# Altium schematic sheet TOR TETRA.SchDoc
size A3
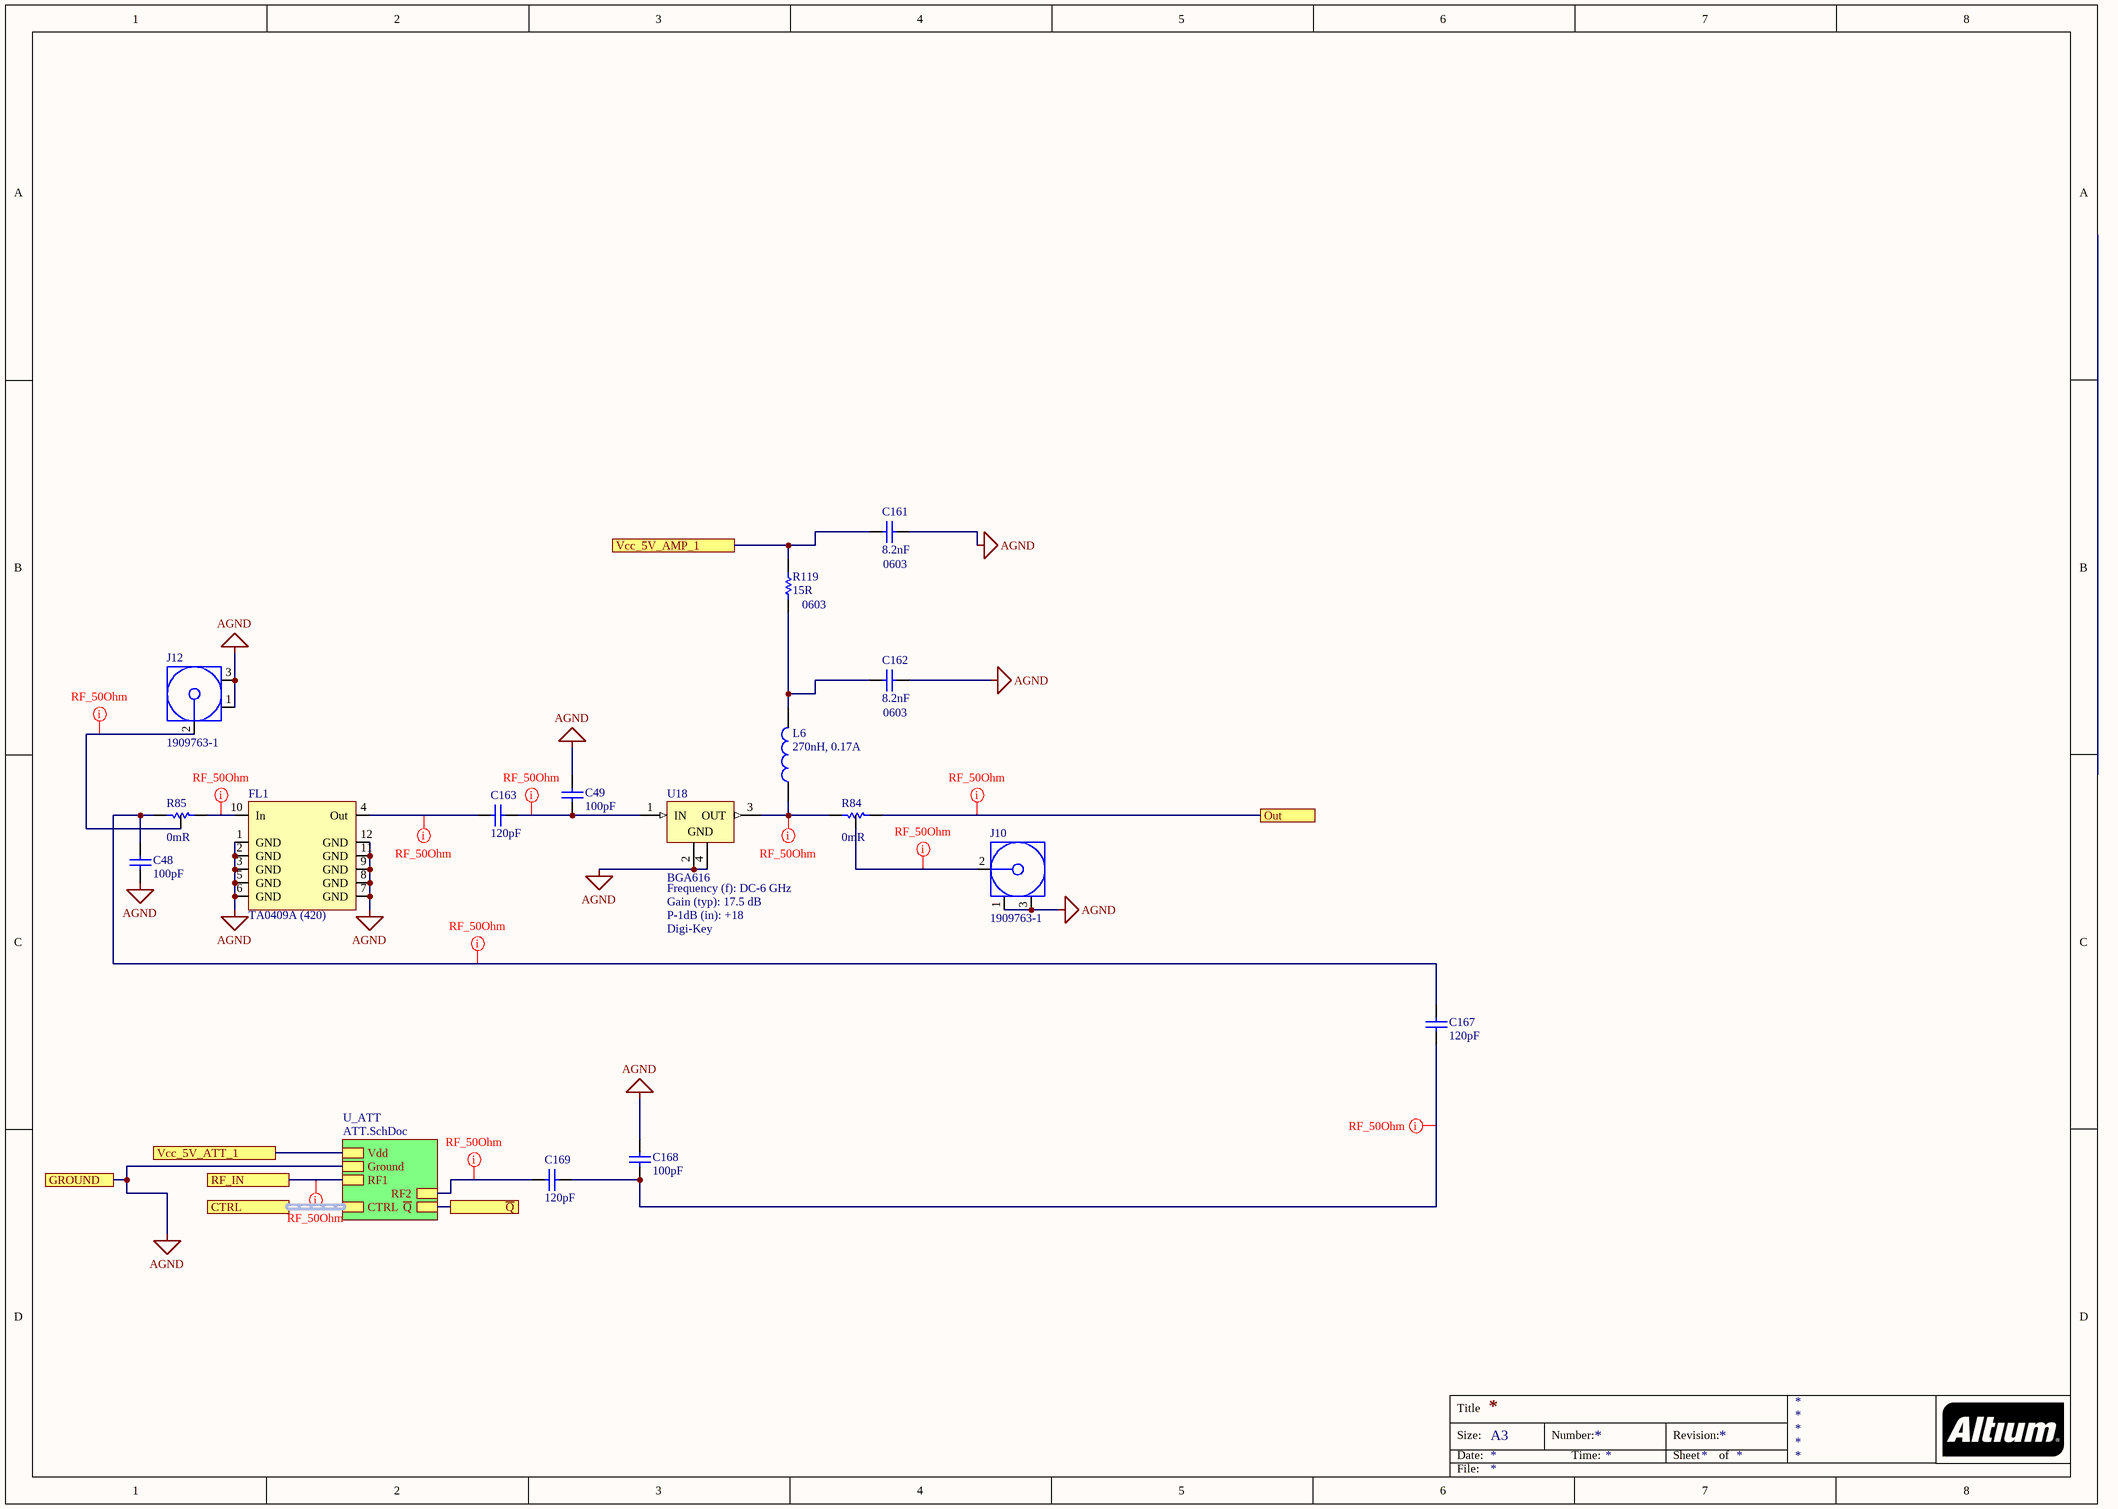
[diagram p0: TOR TETRA.SchDoc]

## Parts
C48  100pF  [CAP 0201/0603 KK]
C49  100pF  [CAP 0201/0603 KK]
C161  8.2nF  Case/Package: 0603  [CAP 0603/1608 RF]
C162  8.2nF  Case/Package: 0603  [CAP 0603/1608 RF]
C163  120pF  [CAP 0402/1005 RF KK]
C167  120pF  [CAP 0402/1005 RF KK]
C168  100pF  [CAP 0201/0603 KK]
C169  120pF  [CAP 0402/1005 RF KK]
FL1  TA0409A (420)  [Tai-Saw_7x5p12]
J10  1909763-1  [TECO-1909763-1_V]
J12  1909763-1  [TECO-1909763-1_V]
L6  270nH, 0.17A  [WE-KI_0603]
R84  0mR  [RES 0402/1005 RF - 3-PADS]
R85  0mR  [RES 0402/1005 RF - 3-PADS]
R119  15R  Case/Package: 0603  [RES 0603/1608 RF]
U18  BGA616  Frequency (f): DC-6 GHz  Gain (typ): 17.5 dB  P-1dB (in): +18  Supplier 2: Digi-Key  [INF-SOT343_V]

## Sub-sheets
U_ATT = ATT.SchDoc: Vdd, Ground, RF1, RF2, CTRL (harness ATT_Controle), ~{Q}

## Ports
CTRL (harness ATT_CTRL), GROUND, Out, RF_IN, Vcc_5V_AMP_1, Vcc_5V_ATT_1, ~{Q}

## Nets
AGND: C48.1 C49.2 C161.2 C162.2 C168.2 FL1.1(GND) FL1.2(GND) FL1.3(GND) FL1.5(GND) FL1.6(GND) FL1.7(GND) FL1.8(GND) FL1.9(GND) FL1.11(GND) FL1.12(GND) J10.1 J10.3 J12.1 J12.3 U18.2(GND) U18.4(GND) ; port GROUND, sheet U_ATT/Ground
Out: R84.2 ; port Out
~{Q}: port ~{Q}, sheet U_ATT/~{Q}
RF_IN: port RF_IN, sheet U_ATT/RF1
Vcc_5V_AMP_1: C161.1 R119.2 ; port Vcc_5V_AMP_1
Vcc_5V_ATT_1: port Vcc_5V_ATT_1, sheet U_ATT/Vdd
NetC48_2: C48.2 C167.2 R85.1
NetC49_1: C49.1 C163.2 U18.1(IN)
NetC162_1: C162.1 L6.2 R119.1
NetC163_1: C163.1 FL1.4(Out)
NetC167_1: C167.1 C168.1 C169.2
NetC169_1: C169.1 ; sheet U_ATT/RF2
NetFL1_10: FL1.10(In) R85.2
NetJ10_2: J10.2 R84.3
NetJ12_2: J12.2 R85.3
NetL6_1: L6.1 R84.1 U18.3(OUT)

## Buses and harness runs
harness port CTRL = sheet U_ATT/CTRL

## Layout directives
net class Single50: NetC48_2, NetC49_1, NetC163_1, NetC167_1, NetC169_1, NetFL1_10, NetJ10_2, NetJ12_2, NetL6_1, Out, RF_IN

## Notes on the sheet
- Title
- Size:
- Date:
- A3
- Number:
- Time:
- Revision:
- Sheet
- of
- File:

## Library data of the parts
C48 C49 C168 = Capacitor: Multilayer Ceramic Capacitors MLCC - SMD/SMT 0201 100pF 25volts C0G +/-5%; Manufacturer: Murata; Manufacturer Part Number: GRM0335C1E101JA01D; Tolerance: 5%; Voltage Rating: 25V; Supplier 1: Digi-Key; Supplier Part Number 1: 490-3160-1-ND; RoHS: Yes; Category: Ceramic Capacitors; Stock 1: 2569728; Pricing 1: 1=0,10000, 10=0,01200, 50=0,00660, 100=0,00530, 500=0,00382, 1000=0,00299, 2500=0,00272, 5000=0,00250 (USD); Mount: Surface Mount; Case/Package: 0201; Case Code (Metric): 0603; Case Code (Imperial): 0201; Min Operating Temperature: -55°C; Max Operating Temperature: 125°C; Package Quantity: 15000; Packaging: Tape and Reel; Capacitance: 100pF; Voltage Rating (DC): 25V; Dielectric: C0G; Termination: SMD/SMT; Voltage: 25V; Length: 0.6mm; Height: 0.3mm; Width: 0.012inch; Thickness: 0.013inch; Depth: 0.3mm; Radiation Hardening: No; REACH SVHC: No SVHC; Lead Free: Lead Free; ComponentLink1URL: https://datasheet.ciiva.com/16497/grm0335c1e101ja01-01-16497112.pdf?src-supplier=Future+Electronics; ComponentLink1Description: https://datasheet.ciiva.com/16497/grm0335c1e101ja01-01-16497112.pdf?src-supplier=Future+Electronics; ComponentLink2URL: https://datasheet.ciiva.com/18697/product-18697797.pdf?src-supplier=Digi-Key; ComponentLink2Description: https://datasheet.ciiva.com/18697/product-18697797.pdf?src-supplier=Digi-Key
C161 C162 = Capacitor: Multilayer Ceramic Capacitors MLCC - SMD/SMT 0603 8,200pF 50volts C0G +/-5%; Manufacturer: Murata; Manufacturer Part Number: GRM1885C1H822JA01D; Voltage Rating: 50V; Tolerance: 5%; Supplier 1: Digi-Key; Supplier Part Number 1: 490-11482-1-ND; RoHS: Yes; Category: Ceramic Capacitors; Stock 1: 65615; Pricing 1: 1=0,21000, 10=0,14200, 50=0,08500, 100=0,07170, 500=0,04908, 1000=0,04341 (USD); Mount: Surface Mount; Case Code (Imperial): 0603; Case Code (Metric): 1608; Min Operating Temperature: -55°C; Max Operating Temperature: 125°C; Dielectric: C0G; Capacitance: 8.2nF; Voltage Rating (DC): 50V; Packaging: Tape and Reel; Package Quantity: 4000; Termination: SMD/SMT; Length: 0.063inch; Height: 0.8mm; Width: 0.031inch; Thickness: 0.035inch; ComponentLink1URL: https://datasheet.ciiva.com/29537/partnumbering-e-01-29537913.pdf?src-supplier=Digi-Key; ComponentLink1Description: https://datasheet.ciiva.com/29537/partnumbering-e-01-29537913.pdf?src-supplier=Digi-Key
C163 C167 C169 = Capacitor: CAP CER 120PF 25V C0G/NP0 0402; Manufacturer: KEMET; Manufacturer Part Number: C0402C121J3GAC7867; Tolerance: 5%; Supplier 1: Digi-Key; Supplier Part Number 1: 399-14880-1-ND; RoHS: No; Category: Ceramic Capacitors; Stock 1: 43311; Pricing 1: 1=0,10000, 10=0,04100, 50=0,02260, 100=0,01840, 500=0,01312, 1000=0,01032, 2500=0,00938, 5000=0,00863 (USD); Mount: Surface Mount; Case/Package: 0402; Case Code (Imperial): 0402; Case Code (Metric): 1005; Min Operating Temperature: -55°C; Max Operating Temperature: 125°C; Packaging: Tape and Reel; Capacitance: 120pF; Voltage Rating: 25V; ComponentLink1URL: https://api.kemet.com/component-edge/download/datasheet/C0402C121J3GAC7867.pdf?src-supplier=Digi-Key; ComponentLink1Description: https://api.kemet.com/component-edge/download/datasheet/C0402C121J3GAC7867.pdf?src-supplier=Digi-Key
FL1 = TA0409A (420): SAW filter 420MHz; BW: 10MHz; IL (max): 3.5dB; In Pow (max): 10 dBm; Impedance In, Out: 50 Ohm; Fc: 420MHz
J10 J12 = 1909763-1: Ultra Miniature Coaxial Connector Jack, 60 V, 50 Ohm, -40 to 90 degC, RoHS, Tape and Reel; Brand: TE Connectivity / AMP; Maximum Frequency: 6 GHz; Gender: Jack (Female); Body Material: Liquid Crystal Polymer (LCP); RF Series: UMCC; Impedance: 50 Ohms; DatasheetVersion: Rev. B2; PackageReference: SMD; PackageDescription: 3-Pin Surface Mount Device, Body 2.6 x 2.6 mm; Supplier 1: Newark; Supplier Part Number 1: 62X0488; Supplier 2: Farnell; Supplier Part Number 2: 2781689; Supplier 3: Digi-Key; Supplier Part Number 3: A118077TR-ND; Supplier 4: Digi-Key; Supplier Part Number 4: A118077CT-ND; Supplier 5: Digi-Key; Supplier Part Number 5: A118077DKR-ND; Product Category: RF Connectors / Coaxial Connectors; Packaging: Reel; Product: Connectors; Orientation: Straight; Operating Temperature Range: - 40 C to + 90 C; Factory Pack Quantity: 5000; RoHS: Details; Contact Plating: Gold; Contact Material: Copper Alloy; Mounting Technology: Surface Mount; ComponentLink1Description: Manufacturer URL; ComponentLink1URL: http://www.te.com; ComponentLink2Description: Datasheet; ComponentLink2URL: http://www.te.com/commerce/DocumentDelivery/DDEController?Action=srchrtrv&DocNm=1909763&DocType=Customer+Drawing&DocLang=English
L6 = 744761227A: WE-KI SMT Wire Wound Ceramic Inductor, size 0603, 270nH, 0.17A; Manufacturer: Wurth Elektronik; Q-Factor min.: 30; Inductance Tolerance: +/-5%; DC Resistance max.: 1.8Ohm; Self Resonant Frequency: 1000MHz; ComponentLink1Description: Manufacturer; ComponentLink1URL: http://www.we-online.de; ComponentLink2Description: Datasheet; ComponentLink2URL: https://www.we-online.com/catalog/datasheet/744761227A.pdf; Published Date: April 2020; Rated Current: 0.17A; Packaging: Tape and Reel; Operating Temperature: -40 to +125degC; Manufacturer Part Number: 744761227A; Size: 0603; Inductance: 270nH; Mounting Technology: SMT
R84 R85 = Resistor: YAGEO - RC0402JR-070RL. - RES, THICK FILM, 0R, 0.0625W, 0402; Power Rating: 62.5mW; Tolerance: 5%; Max Power Dissipation: 63mW; Temperature Coefficient: 200ppm/°C; Voltage Rating: 50V; Supplier 1: Digi-Key; Supplier Part Number 1: 311-0.0JRDKR-ND; Manufacturer: Yageo; Manufacturer Part Number: RC0402JR-070RL; RoHS: Yes; Category: Chip SMD Resistors; Stock 1: 19267045; Pricing 1: 1=0,10000, 10=0,01300, 25=0,00920, 50=0,00720, 100=0,00530, 250=0,00400, 500=0,00320, 1000=0,00236, 5000=0,00169 (USD); Case/Package: 0402; Contact Plating: Tin,Matte; Case Code (Metric): 1005; Case Code (Imperial): 0402; Min Operating Temperature: -55°C; Max Operating Temperature: 155°C; Resistance: 0mR; Packaging: Tape and Reel; Composition: Thick Film; Package Quantity: 1; Number of Terminations: 2; Termination: SMD/SMT; Military Standard: Not; Features: Moisture Resistant; Length: 1mm; Height: 0.016inch; Width: 0.02inch; Depth: 0.5mm; Radiation Hardening: No; Lead Free: Lead Free; REACH SVHC: Unknown; ComponentLink1URL: https://datasheet.ciiva.com/2452/pyu-rc0402-51-rohs-l-6-2452608.pdf?src-supplier=Digi-Key; ComponentLink1Description: https://datasheet.ciiva.com/2452/pyu-rc0402-51-rohs-l-6-2452608.pdf?src-supplier=Digi-Key; ComponentLink2URL: https://datasheet.ciiva.com/11808/0900766b80c66297-11808195.pdf?src-supplier=RSComponents; ComponentLink2Description: https://datasheet.ciiva.com/11808/0900766b80c66297-11808195.pdf?src-supplier=RSComponents; ComponentLink3URL: https://datasheet.ciiva.com/2452/pyu-r-int-thick-7-2452609.pdf?src-supplier=Digi-Key; ComponentLink3Description: https://datasheet.ciiva.com/2452/pyu-r-int-thick-7-2452609.pdf?src-supplier=Digi-Key; ComponentLink4URL: https://datasheet.ciiva.com/2452/pyu-r-int-thick-7-2452610.pdf?src-supplier=Digi-Key; ComponentLink4Description: https://datasheet.ciiva.com/2452/pyu-r-int-thick-7-2452610.pdf?src-supplier=Digi-Key; ComponentLink5URL: https://datasheet.ciiva.com/8896/pyu-rc0402-51-rohs-l-6-8896201.pdf?src-supplier=Avnet; ComponentLink5Description: https://datasheet.ciiva.com/8896/pyu-rc0402-51-rohs-l-6-8896201.pdf?src-supplier=Avnet; ComponentLink6URL: https://datasheet.ciiva.com/28386/pyu-rc0402-51-rohs-l-6-28386633.pdf?src-supplier=Avnet+Europe; ComponentLink6Description: https://datasheet.ciiva.com/28386/pyu-rc0402-51-rohs-l-6-28386633.pdf?src-supplier=Avnet+Europe; ComponentLink7URL: https://datasheet.ciiva.com/22747/1018594-22747515.pdf?src-supplier=Element14; ComponentLink7Description: https://datasheet.ciiva.com/22747/1018594-22747515.pdf?src-supplier=Element14; ComponentLink8URL: https://datasheet.ciiva.com/15189/getdatasheetpartid-326379-15189533.pdf?src-supplier=Verical; ComponentLink8Description: https://datasheet.ciiva.com/15189/getdatasheetpartid-326379-15189533.pdf?src-supplier=Verical; ComponentLink9URL: https://datasheet.ciiva.com/7983/1018594-7983535.pdf?src-supplier=Element14; ComponentLink9Description: https://datasheet.ciiva.com/7983/1018594-7983535.pdf?src-supplier=Element14
R119 = Resistor: RES SMD 15 OHM 0.5% 1/16W 0603; Manufacturer: Susumu; Manufacturer Part Number: RR0816Q-150-D; Power Rating: 63mW; Voltage Rating: 75V; Temperature Coefficient: 50ppm/°C; Supplier 1: Digi-Key; Supplier Part Number 1: RR08Q15DCT-ND; RoHS: Yes; Category: Chip SMD Resistors; Stock 1: 15480; Pricing 1: 1=0,10000, 10=0,09300, 100=0,03580, 1000=0,01575, 2500=0,01360 (USD); Number of Pins: 2; Case Code (Imperial): 0603; Case Code (Metric): 1608; Min Operating Temperature: -55°C; Max Operating Temperature: 125°C; Resistance: 15R; Packaging: Tape and Reel; Tolerance: 0.5%; Package Quantity: 1; Termination: SMD/SMT; Resistor Type: Thin Film; Number of Terminations: 2; Max Power Dissipation: 63mW; Voltage Rating (DC): 75V; Length: 1.6mm; Height: 0.4mm; Width: 0.8mm; Depth: 0.8mm; REACH SVHC: Unknown; Lead Free: Lead Free; ComponentLink1URL: https://datasheet.ciiva.com/11820/0900766b80808d64-11820652.pdf?src-supplier=RSComponents; ComponentLink1Description: https://datasheet.ciiva.com/11820/0900766b80808d64-11820652.pdf?src-supplier=RSComponents; ComponentLink2URL: https://datasheet.ciiva.com/2497/rr-data-sheet-2497981.pdf?src-supplier=Digi-Key; ComponentLink2Description: https://datasheet.ciiva.com/2497/rr-data-sheet-2497981.pdf?src-supplier=Digi-Key; ComponentLink3URL: https://datasheet.ciiva.com/2497/rr-data-sheet-2497982.pdf?src-supplier=Digi-Key; ComponentLink3Description: https://datasheet.ciiva.com/2497/rr-data-sheet-2497982.pdf?src-supplier=Digi-Key; ComponentLink4URL: https://datasheet.ciiva.com/2497/rr-data-sheet-2497983.pdf?src-supplier=Digi-Key; ComponentLink4Description: https://datasheet.ciiva.com/2497/rr-data-sheet-2497983.pdf?src-supplier=Digi-Key
U18 = BGA616: Silicon Germanium Broadband MMIC Amplifier, DC-6 GHz, 17.5 dB Gain, SOT343, Green; Manufacturer: Infineon; F (typ): 2.9 dB; Green: yes; I (typ): 60 mA; DatasheetVersion: Rev. 2.1; PackageReference: SOT343; PackageDescription: 4-Pin Small Outline Transistor Package, 1.25 x 2 mm Body; Supplier 1: Mouser; Supplier Part Number 1: N/A; Halogen-free: yes; Mounting Technology: Surface Mount; PartNumber: BGA616; ComponentLink1Description: Manufacturer URL; ComponentLink1URL: http://www.infineon.com/; ComponentLink2Description: Datasheet; ComponentLink2URL: http://www.infineon.com/dgdl/BGA616.pdf?folderId=db3a30431441fb5d0114b654e6581730&fileId=db3a304314dca3890115419102bb163b&location=en.Products.RF.RF_MMIC.CATV___Broadband_Amplifier.DATASHEET.BGA616.pdf; ComponentLink3Description: Package Specification; ComponentLink3URL: http://www.infineon.com/dgdl/SOT343-Package_Overview.pdf?folderId=db3a30431936bc4b0119535155343cba&fileId=db3a30431936bc4b0119535a9f393cd3; Supplier Part Number 2: BGA616H6327XTSA1CT-ND